# Altium schematic sheet Power Monitor.SchDoc
size B; SheetNumber: 3; SheetTotal: 4
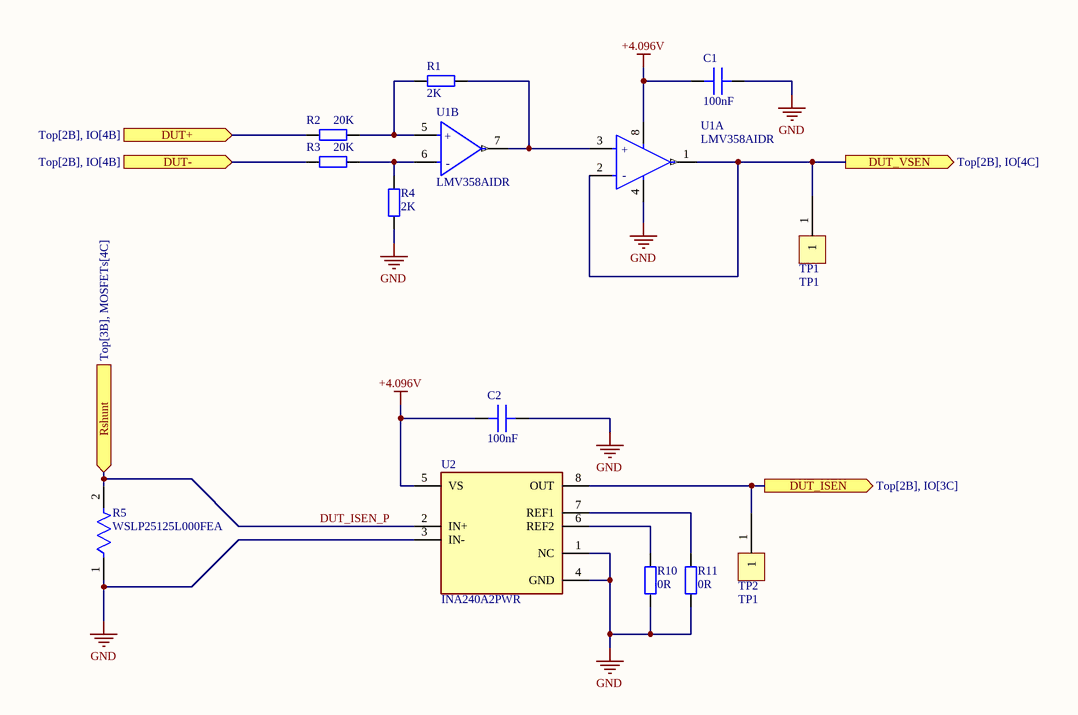
[diagram p0: Power Monitor.SchDoc]

## Parts
C1  100nF  [IPC C C0402 NO SILK]
C2  100nF  [IPC C C0402 NO SILK]
R1  2K  [IPC C R0603 NO SILK]
R2  20K  [IPC C R0603 NO SILK]
R3  20K  [IPC C R0603 NO SILK]
R4  2K  [IPC C R0603 NO SILK]
R5  WSLP25125L000FEA  [FP-WSLP2512-0R005-0R0069-MFG]
R10  0R  [IPC C R0603 NO SILK]
R11  0R  [IPC C R0603 NO SILK]
TP1  TP1  [TP1]
TP2  TP1  [TP1]
U1  LMV358AIDR  [FP-D0008A-IPC_C]  (parts A,B of 2)
U2  INA240A2PWR  [FP-PW0008A-MFG]

## Ports
DUT+ (in, see Top[2B], IO[4B]), DUT- (in, see Top[2B], IO[4B]), DUT_ISEN (out, see Top[2B], IO[3C]), DUT_VSEN (out, see Top[2B], IO[4C]), Rshunt (in, see Top[3B], MOSFETs[4C])

## Nets
+4.096V: C1.2 C2.2 U1.8(V+) U2.5(VS)
GND: C1.1 C2.1 R4.2 R5.1 R10.1 R11.1 U1.4(V-) U2.1(NC) U2.3(IN-) U2.4(GND)
DUT+: R2.1 ; port DUT+
DUT-: R3.1 ; port DUT-
DUT_ISEN: TP2.1 U2.8(OUT) ; port DUT_ISEN
DUT_ISEN_P: R5.2 U2.2(IN+) ; port Rshunt
DUT_VSEN: TP1.1 U1.1(OUT_A) U1.2(-IN_A) ; port DUT_VSEN
NetR1_1: R1.1 R2.2 U1.5(+IN_B)
NetR1_2: R1.2 U1.3(+IN_A) U1.7(OUT_B)
NetR3_2: R3.2 R4.1 U1.6(-IN_B)
NetR10_2: R10.2 U2.6(REF2)
NetR11_2: R11.2 U2.7(REF1)

## Notes on the sheet
- (in symbol CMP-04895-000233-1, part A) +; -
- (in symbol CMP-04895-000233-1, part B) +; -

## Library data of the parts
C1 C2 = CMP-002-000000-1: Source: Schlib1.SchLib; Design Item ID: Generic CAP 0402; Value: 100nF
R1 R4 R10 R11 = CMP-008-000001-2: Generic RES 0603; Design Item ID: Generic RES 0603; Source: Schlib1.SchLib
  R1 R4: Value: 2K
  R10 R11: Value: 0R
R2 R3 = CMP-008-000001-2: Generic RES 0603 / C136942; Value: 20K; Design Item ID: Generic RES 0603; Source: Schlib1.SchLib
R5 = CMP-00030-22061781-1: WSLP25125L000FEA Res Metal Strip 2512 0.005 Ohm 1% 3W ±110ppm/C Sulfur Resistant Pad SMD Automotive T/R; Temperature Coefficient: 110ppm/°C; Resistance: 5mΩ; Max Operating Temperature: 170°C; Height: 635µm; Composition: Metal Element, Metal Strip; Power Rating: 3W; Case Code (Metric): 6432; Width: 3.2mm; Packaging: Cut Tape; Mount: Surface Mount; Lead Free: Lead Free; Case/Package: 2512; Termination: SMD/SMT; Length: 6.4mm; REACH SVHC: Unknown; Tolerance: 1%; NexarPartId: 22061781; Schedule B: 8533210045, 8533210045; RoHS: Compliant; Min Operating Temperature: -65°C; Case Code (Imperial): 2512
TP1 TP2 = CMP-00003-3: Testpoint double sided
U1 = CMP-04895-000233-1: IC OPAMP GP 2 CIRCUIT 8SOIC / C182039; Gain Bandwidth Product: 1MHz; Number of Channels: 2; Input Offset Voltage (Vos): 1mV; Operating Supply Current: 80uA; Input Bias Current: 10pA; Slew Rate: 1.7V/µs; Min Operating Temperature: -40°C; Number of Circuits: 2; Packaging: Cut Tape; Case/Package: SOIC; RoHS Compliant: Yes; Number of Pins: 8; Mount: Surface Mount; Max Operating Temperature: 125°C
U2 = CMP-04895-000047-1: IC AMP CURRENT SENSE 8-TSSOP; Manufacturer: Texas Instruments; Voltage Gain: 0.05V/mV; Max Supply Voltage: 5.5V; Max Junction Temp: +150°C; Input Offset Voltage: 0.005mV; Bandwidth: 400kHz; Min Supply Voltage: 2.7V; Nominal Supply Current: 1.8mA; Standoff Height: 0.05mm; Number Of Channels: 1; Input Bias Current: 90uA; ComponentLink2URL: http://www.ti.com/lit/ds/symlink/ina240.pdf; Device Class L2: Linear ICs; ComponentLink2Description: Datasheet; Temperature: -40°C to +125°C; Octopart: https://octopart.com/ina240a2pwr-texas+instruments-75431049; Automotive: No; Manufacturer Part Number: INA240A2PWR; Ambient Temperature Range Low: -40°C; RoHS: TRUE; Package: PW0008A; Device Class L1: Integrated Circuits (ICs); Temperature Range Low: -40°C; Category: IC; Ipc Land Pattern Name: SOP65P300X120-8; Temperature Range High: +125°C; Ambient Temperature Range High: +125°C; Height: 1.2mm; Lead Free: Yes; Device Class L3: Instrumentation; Digikey Description: IC AMP CURRENT SENSE 8-TSSOP